# Altium schematic sheet SDRAM，JTAG，I2C EEPROM，SD Card.SchDoc
size A4; SheetNumber: 3; SheetTotal: 16
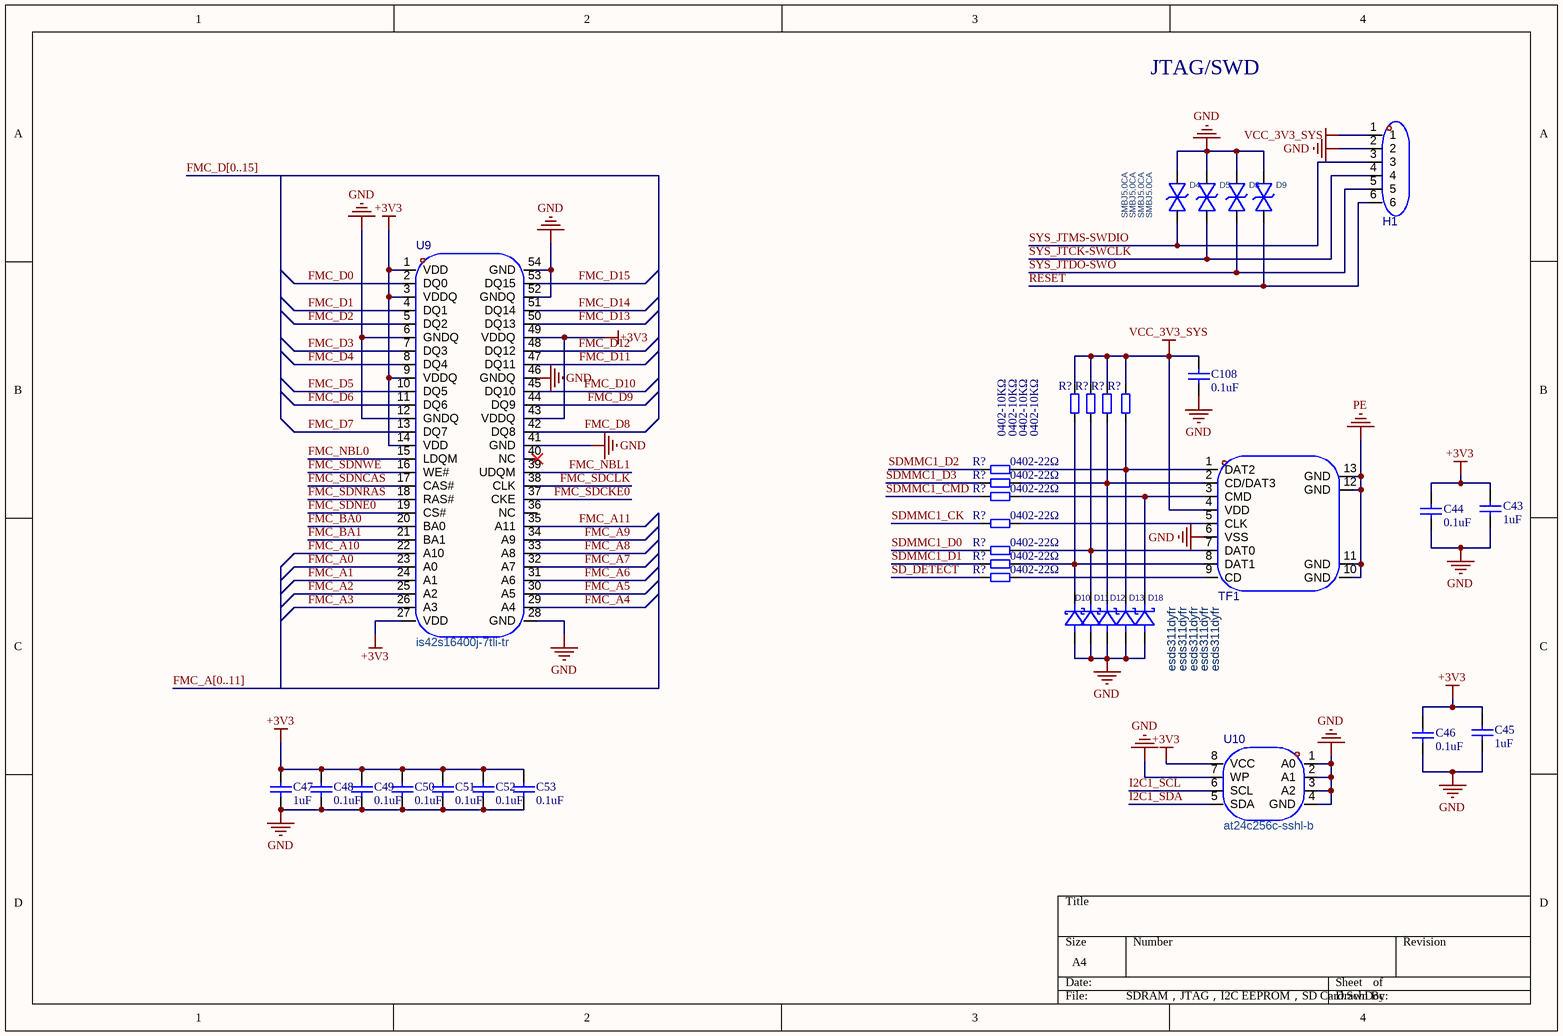
[diagram p0: SDRAM，JTAG，I2C EEPROM，SD Card.SchDoc]

## Parts
(Parts that share a designator on the sheet are numbered #1, #2 ... from top to bottom, then left to right.)
C43  1uF  [C0603]
C44  0.1uF  [C0603]
C45  1uF  [C0603]
C46  0.1uF  [C0603]
C47  1uF  [C0603]
C48  0.1uF  [C0603]
C49  0.1uF  [C0603]
C50  0.1uF  [C0603]
C51  0.1uF  [C0603]
C52  0.1uF  [C0603]
C53  0.1uF  [C0603]
C108  0.1uF  [C0603]
D4  SMBJ5.0CA  [SMB_L4.6-W3.6-LS5.3-BI]
D5  SMBJ5.0CA  [SMB_L4.6-W3.6-LS5.3-BI]
D8  SMBJ5.0CA  [SMB_L4.6-W3.6-LS5.3-BI]
D9  SMBJ5.0CA  [SMB_L4.6-W3.6-LS5.3-BI]
D10  esds311dyfr  [SOD-323_L1.7-W1.3-LS2.6-RD-1]
D11  esds311dyfr  [SOD-323_L1.7-W1.3-LS2.6-RD-1]
D12  esds311dyfr  [SOD-323_L1.7-W1.3-LS2.6-RD-1]
D13  esds311dyfr  [SOD-323_L1.7-W1.3-LS2.6-RD-1]
D18  esds311dyfr  [SOD-323_L1.7-W1.3-LS2.6-RD-1]
H1  pz254v-11-06p  [HDR-TH_6P-P2.54-V-M]  (value not drawn)
R?#1  0402-10KΩ  [R0402]
R?#2  0402-10KΩ  [R0402]
R?#3  0402-10KΩ  [R0402]
R?#4  0402-10KΩ  [R0402]
R?#5  0402-22Ω  [R0402]
R?#6  0402-22Ω  [R0402]
R?#7  0402-22Ω  [R0402]
R?#8  0402-22Ω  [R0402]
R?#9  0402-22Ω  [R0402]
R?#10  0402-22Ω  [R0402]
R?#11  0402-22Ω  [R0402]
TF1  tf-card h1.8  [TF-SMD_TF-CARD-H1.8]  (value not drawn)
U9  is42s16400j-7tli-tr  [TSOP-54_L22.2-W10.2-P0.80-LS11.8-BL]
U10  at24c256c-sshl-b  [SOIC-8_L4.9-W3.9-P1.27-LS6.0-BL]

## Nets
+3V3: C43.2 C44.2 C45.2 C46.2 C47.2 C48.2 C49.2 C50.2 C51.2 C52.2 C53.2 U9.1(VDD) U9.3(VDDQ) U9.9(VDDQ) U9.14(VDD) U9.27(VDD) U9.43(VDDQ) U9.49(VDDQ) U10.8(VCC)
GND: C43.1 C44.1 C45.1 C46.1 C47.1 C48.1 C49.1 C50.1 C51.1 C52.1 C53.1 C108.1 D4.2 D5.2 D8.2 D9.2 D10.2(A) D11.2(A) D12.2(A) D13.2(A) D18.2(A) H1.2 TF1.6(VSS) U9.6(GNDQ) U9.12(GNDQ) U9.28(GND) U9.41(GND) U9.46(GNDQ) U9.52(GNDQ) U9.54(GND) U10.1(A0) U10.2(A1) U10.3(A2) U10.4(GND) U10.7(WP)
PE: TF1.10(GND) TF1.11(GND) TF1.12(GND) TF1.13(GND)
VCC_3V3_SYS: C108.2 H1.1 R?#1.2 R?#2.2 R?#3.2 R?#4.2 TF1.4(VDD)
FMC_A0: U9.23(A0)
FMC_A1: U9.24(A1)
FMC_A2: U9.25(A2)
FMC_A3: U9.26(A3)
FMC_A4: U9.29(A4)
FMC_A5: U9.30(A5)
FMC_A6: U9.31(A6)
FMC_A7: U9.32(A7)
FMC_A8: U9.33(A8)
FMC_A9: U9.34(A9)
FMC_A10: U9.22(A10)
FMC_A11: U9.35(A11)
FMC_BA0: U9.20(BA0)
FMC_BA1: U9.21(BA1)
FMC_D0: U9.2(DQ0)
FMC_D1: U9.4(DQ1)
FMC_D2: U9.5(DQ2)
FMC_D3: U9.7(DQ3)
FMC_D4: U9.8(DQ4)
FMC_D5: U9.10(DQ5)
FMC_D6: U9.11(DQ6)
FMC_D7: U9.13(DQ7)
FMC_D8: U9.42(DQ8)
FMC_D9: U9.44(DQ9)
FMC_D10: U9.45(DQ10)
FMC_D11: U9.47(DQ11)
FMC_D12: U9.48(DQ12)
FMC_D13: U9.50(DQ13)
FMC_D14: U9.51(DQ14)
FMC_D15: U9.53(DQ15)
FMC_NBL0: U9.15(LDQM)
FMC_NBL1: U9.39(UDQM)
FMC_SDCKE0: U9.37(CKE)
FMC_SDCLK: U9.38(CLK)
FMC_SDNCAS: U9.17(CAS#)
FMC_SDNE0: U9.19(CS#)
FMC_SDNRAS: U9.18(RAS#)
FMC_SDNWE: U9.16(WE#)
I2C1_SCL: U10.6(SCL)
I2C1_SDA: U10.5(SDA)
RESET: D9.1 H1.6
SD_DETECT: R?#11.1
SDMMC1_CK: R?#8.1
SDMMC1_CMD: R?#7.1
SDMMC1_D0: R?#9.1
SDMMC1_D1: R?#10.1
SDMMC1_D2: R?#5.1
SDMMC1_D3: R?#6.1
SYS_JTCK-SWCLK: D5.1 H1.4
SYS_JTDO-SWO: D8.1 H1.5
SYS_JTMS-SWDIO: D4.1 H1.3
NetD10_1: D10.1(K) R?#1.1 R?#10.2 TF1.8(DAT1)
NetD11_1: D11.1(K) R?#2.1 R?#9.2 TF1.7(DAT0)
NetD12_1: D12.1(K) R?#3.1 R?#6.2 TF1.2(CD/DAT3)
NetD13_1: D13.1(K) R?#4.1 R?#5.2 TF1.1(DAT2)
NetD18_1: D18.1(K) R?#7.2 TF1.3(CMD)
NetR?#8_2: R?#8.2 TF1.5(CLK)
NetR?#11_2: R?#11.2 TF1.9(CD)

Not connected (* = marked no-connect by the designer): U9 36(NC) 40(NC)*

## Buses and harness runs
bus \ = FMC_A[0..11]
bus FMC_D[0..15]

## Notes on the sheet
- JTAG/SWD

## Library data of the parts
C43-C53 C108 = C0603: Capacitor; Value: 104; Published: 8-Jun-2000; LatestRevisionDate: 17-Jul-2002; LatestRevisionNote: Re-released for DXP Platform.; Publisher: Altium Limited
D4 D5 D8 D9 = SMBJ5.0CA_C19077559: PWR 5V; Manufacturer: 宏嘉诚; Add into BOM: yes; Polarity: 双向; Clamping Voltage: 9.2V; Peak Pulse Current (Ipp): 65.22A; Peak Pulse Power Dissipation (Ppp): 600W; Voltage - Breakdown: 7V; Reverse Leakage Current (Ir): 800uA; Type: TVS; Symbol: SMBJ5.0CA_C19077559; Device: SMBJ5.0CA_C19077559; LCSC Part Name: SMBJ5.0CA; Supplier Part: C19077559; Manufacturer Part: SMBJ5.0CA; Supplier Footprint: SMB; JLCPCB Part Class: Extended Part; Datasheet: https://atta.szlcsc.com/upload/public/pdf/source/20250107/474F05451FC8AB27D7FA0238914F96F6.pdf; Supplier: LCSC; Convert to PCB: yes; Reverse Stand-Off Voltage (Vrwm): 5V; Operating Temperature: -
D10-D13 D18 = esds311dyfr: 极性:单向;反向截止电压(Vrwm):3.6V;钳位电压:7.7V;峰值脉冲电流(Ipp):25A@8/20us;峰值脉冲功率(Ppp):170W@8/20us;击穿电压(VBR):7.5V;; Manufacturer: TI(德州仪器); AddInBom: yes; ModelId: eba151483b2844ffacda3a6d97308fa1; ModelTransform: 100.394,49.2125,0,0,0,0,0,0,0; Polarity: 单向; Reverse Stand-Off Voltage (Vrwm): 3.6V; Clamping Voltage: 7.7V; Voltage - Breakdown: 7.5V; Reverse Leakage Current (Ir): 5nA; Number of Channels: 单路; level of protection: IEC 61000-4-4；IEC 61000-4-5；IEC 61000-4-2; Type: TVS; Junction Capacitance: 4.5pF; LCSC Part Name: 单向TVS 3.6V截止 峰值浪涌电流：25A@8/20us; SupplierPart: C30938562; ManufacturerPart: ESDS311DYFR; Supplier Footprint: SOD-323; JLCPCB Part Class: Extended Part; Datasheet: https://www.ti.com.cn/cn/lit/ds/symlink/esds311.pdf?ts=1736913524660&ref_url=https%253A%252F%252Fwww.ti.com.cn%252Fsitesearch%252Fzh-cn%252Fdocs%252Funiversalsearch.tsp%253FlangPref%253Dzh-CN%2526nr%253D9%2526searchTerm%253DESDS311DYFR; Supplier: LCSC; ConvertToPcb: yes; SymbolName: ESDS311DYFR; FootprintName: SOD-323_L1.7-W1.3-LS2.6-RD-1; ModelName: SOD-323_L1.7-W1.3-LS2.6-RD-1; Peak Pulse Current (Ipp): 25A@8/20us; Peak Pulse Power Dissipation (Ppp): 170W@8/20us; Operating Temperature: -40℃~+125℃
H1 = pz254v-11-06p: 插针结构:1x6P;间距:2.54mm;行距:-;圆针/方针:方针;安装方式:直插;排数:单排;总PIN位数:6P;额定电流:3A;额定电压:250V;配合针长度:6mm;塑高:2.5mm;端接针长度:3mm;触头材质:黄铜;触头镀层:-;工作温度:-40℃~+105℃;颜色:黑色;; Manufacturer: XFCN(兴飞); AddInBom: yes; ModelId: 66a147c6933d4029b68665bbcd1e2924; ModelName: HDR-TH_6P-P2.54-M-LI-1X6P; ModelTransform: 590.1563,98.425,0,0,0,0,0,0,-118.11; Pin Structure: 1x6P; Pitch: 2.54mm; Circluar Pins/Square Pins: 方针; Current Rating: 3A; Voltage Rating (Max): 250V; Symbol: PZ254V-11-06P; LCSC Part Name: 1x6P 间距:2.54mm 方针 直插; SupplierPart: C492405; ManufacturerPart: PZ254V-11-06P; Supplier Footprint: 插件,P=2.54mm; JLCPCB Part Class: Extended Part; Datasheet: https://item.szlcsc.com/datasheet/PZ254V-11-06P/502961.html; Supplier: LCSC; ConvertToPcb: yes; FootprintName: HDR-TH_6P-P2.54-V-M; Row Spacing: -; Mounting Type: 直插; Number of Rows: 单排; Number of Pins: 6P; Length of Mating Pin: 6mm; Insulation Height: 2.5mm; Length of End Connection Pin: 3mm; Contact Material: 黄铜; Contact Plating: -; Operating Temperature: -40℃~+105℃; Color: 黑色
R?#1-R?#11 = R0402: 片式电阻; 物料描述: 片式电阻器-0805-10KΩ-5%-JT; 物料号: NA
TF1 = tf-card h1.8: 卡连接方式:自弹式;卡类型:MicroSD卡(TF卡);连接器类型:卡座;本体最大高度:1.8mm;工作温度:-40℃~+70℃;; Manufacturer: SHOU HAN(首韩); AddInBom: yes; ModelId: 9b9c093eaf784fafb0b50515d8d92d39; ModelTransform: 631.8885,594.487,0,0,0,0,-0.002,-75.432,-23.622; Card Connection Mode: 自弹式; Connector Type: 卡座; Symbol: TF-CARD H1.8; LCSC Part Name: 9P，自弹式TF卡座; SupplierPart: C7529389; ManufacturerPart: TF-CARD H1.8; Supplier Footprint: SMD; JLCPCB Part Class: Extended Part; Datasheet: https://item.szlcsc.com/datasheet/TF-CARD%2520H1.8/8629776.html; Supplier: LCSC; ConvertToPcb: yes; FootprintName: TF-SMD_TF-CARD-H1.8; ModelName: TF-SMD_TF-CARD-H1.8; Card Type: MicroSD卡(TF卡); Additional Card Detection Pins: -; Supplementary Features: -; Height Above Board: 1.8mm; Operating Temperature: -40℃~+70℃
U9 = is42s16400j-7tli-tr: 存储容量:64Mbit;时钟频率(fc):200MHz;; Manufacturer: ISSI(美国芯成); AddInBom: yes; ModelId: 700c07346ffc4ca1812a693d2a0f333f; ModelName: TSOP-54_L22.2-W10.2-H1.2-LS11.8-P0.80; ModelTransform: 464.567,872.538,0,90,0,0,0,-0.0005,0; Memory Size: 64Mbit; Clock Frequency: 200MHz; Voltage - Supply: 3V~3.6V; Symbol: IS42S16400J-7TLI; LCSC Part Name: 停产 64Mb同步动态随机存取存储器; SupplierPart: C94865; ManufacturerPart: IS42S16400J-7TLI-TR; Supplier Footprint: TSOPII-54-10.2mm; JLCPCB Part Class: Extended Part; Datasheet: https://item.szlcsc.com/datasheet/IS42S16400J-7TLI-TR/96065.html; Supplier: LCSC; ConvertToPcb: yes; FootprintName: TSOP-54_L22.2-W10.2-P0.80-LS11.8-BL; Operating Temperature: -40℃~+85℃
U10 = at24c256c-sshl-b_c615461: 接口类型:I2C;存储容量:256Kbit;时钟频率(fc):1MHz;; Manufacturer: MICROCHIP(美国微芯); AddInBom: yes; ModelId: e81d2f7d937b4a6ab1dca543ff5d56a4; ModelName: SOIC-8_L4.9-W3.9-H1.7-LS6.0-P1.27; ModelTransform: 192.913,236.22,0,0,0,0,0,0,0; Interface: I2C; Clock Frequency: 1MHz; Write Cycle Time(Tw): 5ms; Data Retention - TDR (Year): 100年; Write Cycle Endurance: 100万次; Voltage - Supply: 1.7V~5.5V; Symbol: AT24C256C-SSHL-B; LCSC Part Name: 支持I²C接口的串行EEPROM; SupplierPart: C615461; ManufacturerPart: AT24C256C-SSHL-B; Supplier Footprint: SOIC-8; JLCPCB Part Class: Extended Part; Datasheet: https://item.szlcsc.com/datasheet/AT24C256C-SSHL-B/645439.html; Supplier: LCSC; ConvertToPcb: yes; FootprintName: SOIC-8_L4.9-W3.9-P1.27-LS6.0-BL; Memory Size: 256Kbit; Features: 内置上电复位(POR)；硬件写保护功能；噪声抑制功能; Operating Temperature: -40℃~+85℃